# Altium project DBS-Stepper-Module-v1.0.PrjPcb (part 1 of 4)
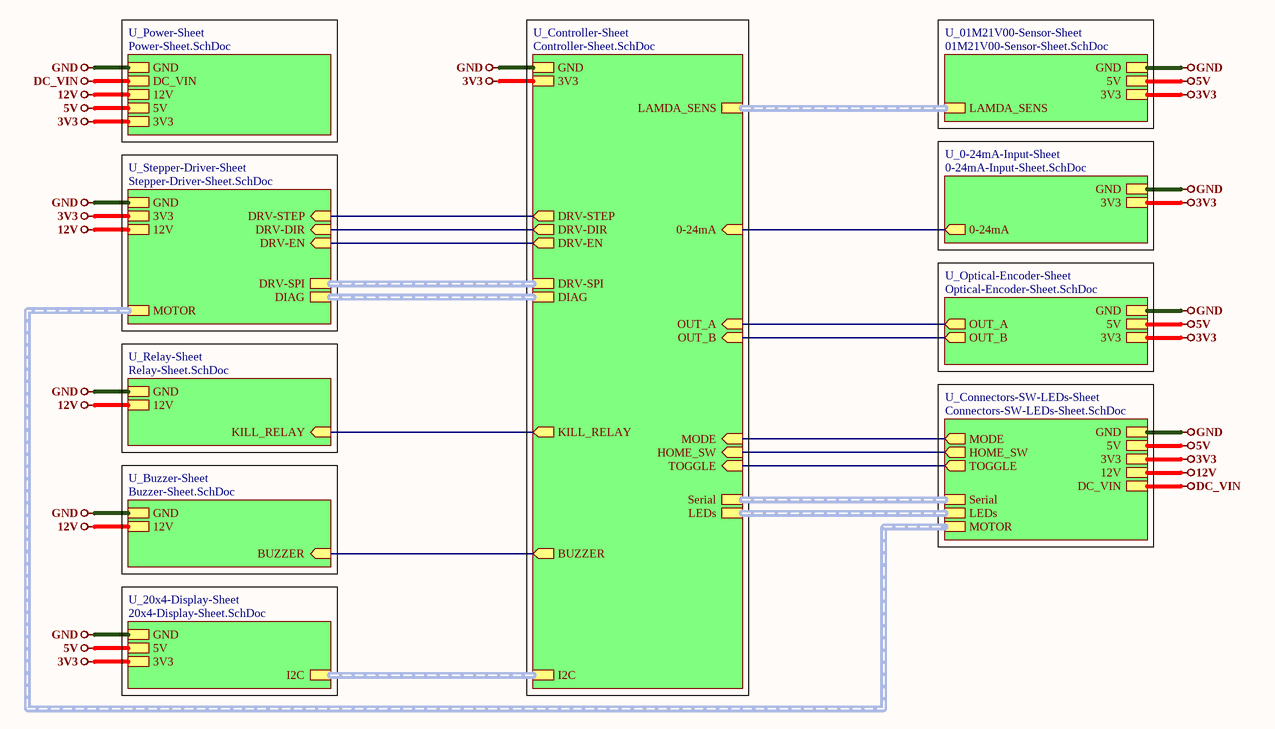
[diagram p0: Top-Sheet.SchDoc]
11 sheets, 149 parts. Net scope: hierarchical (ports join the sheet entries above them; power ports are global).
Board file: PCB_DBS_Module-v1.0.PcbDoc
Sheets:
  Top-Sheet.SchDoc
    U_Power-Sheet = Power-Sheet.SchDoc
    U_Controller-Sheet = Controller-Sheet.SchDoc
    U_Stepper-Driver-Sheet = Stepper-Driver-Sheet.SchDoc
    U_Relay-Sheet = Relay-Sheet.SchDoc
    U_Buzzer-Sheet = Buzzer-Sheet.SchDoc
    U_20x4-Display-Sheet = 20x4-Display-Sheet.SchDoc
    U_01M21V00-Sensor-Sheet = 01M21V00-Sensor-Sheet.SchDoc
    U_0-24mA-Input-Sheet = 0-24mA-Input-Sheet.SchDoc
    U_Optical-Encoder-Sheet = Optical-Encoder-Sheet.SchDoc
    U_Connectors-SW-LEDs-Sheet = Connectors-SW-LEDs-Sheet.SchDoc

## Sheet Top-Sheet.SchDoc
size A4; SheetNumber: 1; SheetTotal: 11

### Sub-sheets
U_0-24mA-Input-Sheet = 0-24mA-Input-Sheet.SchDoc: GND, 3V3, 0-24mA (out)
U_01M21V00-Sensor-Sheet = 01M21V00-Sensor-Sheet.SchDoc: GND, 5V, 3V3, LAMDA_SENS (harness LAMDA_SENS)
U_20x4-Display-Sheet = 20x4-Display-Sheet.SchDoc: GND, 5V, 3V3, I2C (harness I2C)
U_Buzzer-Sheet = Buzzer-Sheet.SchDoc: GND, 12V, BUZZER (in)
U_Connectors-SW-LEDs-Sheet = Connectors-SW-LEDs-Sheet.SchDoc: GND, 5V, 3V3, DC_VIN, Serial (harness Serial), MODE (out), HOME_SW (out), TOGGLE (out), MOTOR (harness MOTOR), 12V, LEDs (harness LEDs)
U_Controller-Sheet = Controller-Sheet.SchDoc: GND, 3V3, DRV-SPI (harness DRV-SPI), DIAG (harness DIAG), DRV-STEP (out), DRV-DIR (out), DRV-EN (out), KILL_RELAY (out), BUZZER (out), I2C (harness I2C), LAMDA_SENS (harness LAMDA_SENS), 0-24mA (in), OUT_A (in), OUT_B (in), Serial (harness Serial), MODE (in), HOME_SW (in), TOGGLE (in), LEDs (harness LEDs)
U_Optical-Encoder-Sheet = Optical-Encoder-Sheet.SchDoc: GND, 5V, 3V3, OUT_A (out), OUT_B (out)
U_Power-Sheet = Power-Sheet.SchDoc: GND, DC_VIN, 12V, 5V, 3V3
U_Relay-Sheet = Relay-Sheet.SchDoc: GND, 12V, KILL_RELAY (in)
U_Stepper-Driver-Sheet = Stepper-Driver-Sheet.SchDoc: GND, 3V3, 12V, MOTOR (harness MOTOR), DRV-SPI (harness DRV-SPI), DIAG (harness DIAG), DRV-STEP (in), DRV-DIR (in), DRV-EN (in)

### Nets
3V3: sheet U_Power-Sheet/3V3, sheet U_Controller-Sheet/3V3, sheet U_Stepper-Driver-Sheet/3V3, sheet U_20x4-Display-Sheet/3V3, sheet U_01M21V00-Sensor-Sheet/3V3, sheet U_0-24mA-Input-Sheet/3V3, sheet U_Optical-Encoder-Sheet/3V3, sheet U_Connectors-SW-LEDs-Sheet/3V3
5V: sheet U_Power-Sheet/5V, sheet U_20x4-Display-Sheet/5V, sheet U_01M21V00-Sensor-Sheet/5V, sheet U_Optical-Encoder-Sheet/5V, sheet U_Connectors-SW-LEDs-Sheet/5V
12V: sheet U_Power-Sheet/12V, sheet U_Stepper-Driver-Sheet/12V, sheet U_Relay-Sheet/12V, sheet U_Buzzer-Sheet/12V, sheet U_Connectors-SW-LEDs-Sheet/12V
DC_VIN: sheet U_Power-Sheet/DC_VIN, sheet U_Connectors-SW-LEDs-Sheet/DC_VIN
GND: sheet U_Power-Sheet/GND, sheet U_Controller-Sheet/GND, sheet U_Stepper-Driver-Sheet/GND, sheet U_Relay-Sheet/GND, sheet U_Buzzer-Sheet/GND, sheet U_20x4-Display-Sheet/GND, sheet U_01M21V00-Sensor-Sheet/GND, sheet U_0-24mA-Input-Sheet/GND, sheet U_Optical-Encoder-Sheet/GND, sheet U_Connectors-SW-LEDs-Sheet/GND
0-24mA: sheet U_Controller-Sheet/0-24mA, sheet U_0-24mA-Input-Sheet/0-24mA
BUZZER: sheet U_Controller-Sheet/BUZZER, sheet U_Buzzer-Sheet/BUZZER
DRV-DIR: sheet U_Controller-Sheet/DRV-DIR, sheet U_Stepper-Driver-Sheet/DRV-DIR
DRV-EN: sheet U_Controller-Sheet/DRV-EN, sheet U_Stepper-Driver-Sheet/DRV-EN
DRV-STEP: sheet U_Controller-Sheet/DRV-STEP, sheet U_Stepper-Driver-Sheet/DRV-STEP
HOME_SW: sheet U_Controller-Sheet/HOME_SW, sheet U_Connectors-SW-LEDs-Sheet/HOME_SW
KILL_RELAY: sheet U_Controller-Sheet/KILL_RELAY, sheet U_Relay-Sheet/KILL_RELAY
MODE: sheet U_Controller-Sheet/MODE, sheet U_Connectors-SW-LEDs-Sheet/MODE
OUT_A: sheet U_Controller-Sheet/OUT_A, sheet U_Optical-Encoder-Sheet/OUT_A
OUT_B: sheet U_Controller-Sheet/OUT_B, sheet U_Optical-Encoder-Sheet/OUT_B
TOGGLE: sheet U_Controller-Sheet/TOGGLE, sheet U_Connectors-SW-LEDs-Sheet/TOGGLE

### Buses and harness runs
harness sheet U_01M21V00-Sensor-Sheet/LAMDA_SENS = sheet U_Controller-Sheet/LAMDA_SENS
harness sheet U_20x4-Display-Sheet/I2C = sheet U_Controller-Sheet/I2C
harness sheet U_Connectors-SW-LEDs-Sheet/LEDs = sheet U_Controller-Sheet/LEDs
harness sheet U_Connectors-SW-LEDs-Sheet/MOTOR = sheet U_Stepper-Driver-Sheet/MOTOR
harness sheet U_Connectors-SW-LEDs-Sheet/Serial = sheet U_Controller-Sheet/Serial
harness sheet U_Controller-Sheet/DIAG = sheet U_Stepper-Driver-Sheet/DIAG
harness sheet U_Controller-Sheet/DRV-SPI = sheet U_Stepper-Driver-Sheet/DRV-SPI

### Notes on the sheet
- File:
- Title:
- Date:
- Page
- Num:
- Total:
- Drawn By: Huzaifa Ali

## Sheet Power-Sheet.SchDoc
size A4; SheetNumber: 2; SheetTotal: 11
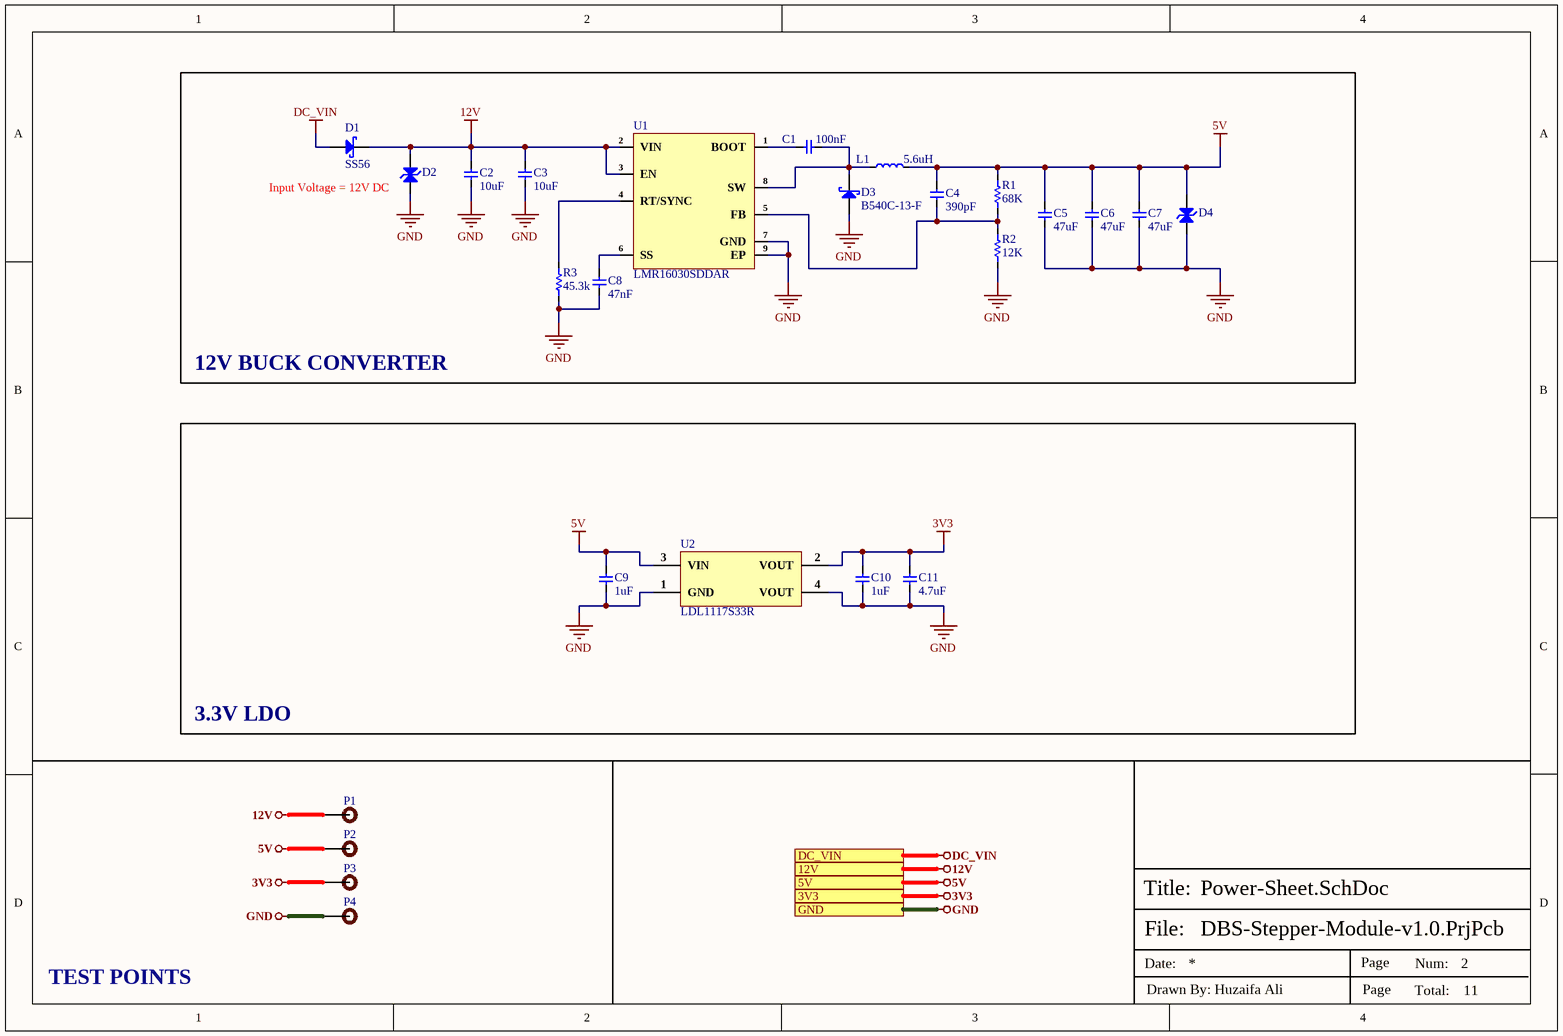
[diagram p1: Power-Sheet.SchDoc]

### Parts
C1  100nF  [Cap-0603]
C2  10uF  [Cap-1206]
C3  10uF  [Cap-1206]
C4  390pF  [Cap-0402]
C5  47uF  [Cap-1206]
C6  47uF  [Cap-1206]
C7  47uF  [Cap-1206]
C8  47nF  [Cap-0402]
C9  1uF  [Cap-0603]
C10  1uF  [Cap-0603]
C11  4.7uF  [Cap-0603]
D1  SS56  [SMA]
D2  SMAJ12CA  [SMA Bi Directional]  (value not drawn)
D3  B540C-13-F  [SMC]
D4  SMAJ5.0CA  [SMA Bi Directional]  (value not drawn)
L1  5.6uH  [FXL0630-5R6-M]
P1  TEST POINT 0.5mm Dia  [Test-point - 0.5mm]  (value not drawn)
P2  TEST POINT 0.5mm Dia  [Test-point - 0.5mm]  (value not drawn)
P3  TEST POINT 0.5mm Dia  [Test-point - 0.5mm]  (value not drawn)
P4  TEST POINT 0.5mm Dia  [Test-point - 0.5mm]  (value not drawn)
R1  68K  [Res-0603]
R2  12K  [Res-0603]
R3  45.3k  [Res-0402]
U1  LMR16030SDDAR  [8-SO-EP_]
U2  LDL1117S33R  [SOT- 223]

### Blocks framed on the sheet
12V BUCK CONVERTER: C1-C8 D1-D4 L1 R1-R3 U1
3.3V LDO: C9-C11 U2

### Ports
3V3 (see Top-Sheet[1A], 0-24mA-Input-Sheet[3D], 01M21V00-Sensor-Sheet[3D], 20x4-Display-Sheet[3D], Connectors-SW-LEDs-Sheet[3D], Controller-Sheet[3D], Optical-Encoder-Sheet[3D], Stepper-Driver-Sheet[3D]), 5V (see Top-Sheet[1A], 01M21V00-Sensor-Sheet[3D], 20x4-Display-Sheet[3D], Connectors-SW-LEDs-Sheet[3D], Optical-Encoder-Sheet[3D]), 12V (see Top-Sheet[1A], Buzzer-Sheet[3D], Connectors-SW-LEDs-Sheet[3D], Relay-Sheet[3D], Stepper-Driver-Sheet[3D]), DC_VIN (see Top-Sheet[1A], Connectors-SW-LEDs-Sheet[3D]), GND (see Top-Sheet[1A], 0-24mA-Input-Sheet[3D], 01M21V00-Sensor-Sheet[3D], 20x4-Display-Sheet[3D], Buzzer-Sheet[3D], Connectors-SW-LEDs-Sheet[3D], Controller-Sheet[3D], Optical-Encoder-Sheet[3D], Relay-Sheet[3D], Stepper-Driver-Sheet[3D])

### Nets
3V3: C10.2 C11.2 P3.1 U2.2(VOUT) ; port 3V3
5V: C4.2 C5.2 C6.2 C7.2 C9.2 D4.2(K) L1.2 P2.1 R1.2 U2.3(VIN) ; port 5V
12V: C2.2 C3.2 D1.1(K) D2.2(K) P1.1 U1.2(VIN) U1.3(EN) ; port 12V
DC_VIN: D1.2(A) ; port DC_VIN
GND: C2.1 C3.1 C5.1 C6.1 C7.1 C8.1 C9.1 C10.1 C11.1 D2.1(A) D3.2(A) D4.1(A) P4.1 R2.1 R3.1 U1.7(GND) U1.9(EP) U2.1(GND) U2.4(VOUT) ; port GND
NetC1_1: C1.1 D3.1(K) L1.1 U1.8(SW)
NetC1_2: C1.2 U1.1(BOOT)
NetC4_1: C4.1 R1.1 R2.2 U1.5(FB)
NetC8_2: C8.2 U1.6(SS)
NetR3_2: R3.2 U1.4(RT/SYNC)

### Notes on the sheet
- (near D2) Input Voltage = 12V DC
- TEST POINTS
- File:
- Title:
- Date:
- Page
- Num:
- Total:
- Drawn By: Huzaifa Ali

### Library data of the parts
C1 = CC0603KRX5R9BB104: CAP CER 0.1UF 50V X5R 0603; Manufacturer: Yageo; Tolerance: 10%; Item Type: Capacitor; Supplier 1: Digi-Key; Manufacturer Part Number: CC0603KRX5R9BB104; RoHS: Yes; Category: Ceramic Capacitors; Stock 1: 152253; Pricing 1: 1=0.10000, 10=0.05200, 50=0.02820, 100=0.02310, 500=0.01648, 1000=0.01294 (USD); Mount: Surface Mount; Case/Package: 0603; Case Code (Imperial): 0603; Case Code (Metric): 1608; Weight: 7.1E-05oz; Min Operating Temperature: -55°C; Max Operating Temperature: 85°C; Capacitance: 100nF; Packaging: Tape and Reel; Voltage Rating: 50V; Dielectric: X5R; Termination: SMD/SMT; Voltage Rating (DC): 50V; Package Quantity: 4000; Length: 0.063inch; Width: 0.031inch; Thickness: 0.035inch; Lead Free: Lead Free; Halogen Free: Halogen Free; ComponentLink1URL: http://www.mouser.com/ds/2/447/Yageo_UPY-GP_NP0_16V-to-50V_9-358835.pdf?src-supplier=Mouser; ComponentLink1Description: http://www.mouser.com/ds/2/447/Yageo_UPY-GP_NP0_16V-to-50V_9-358835.pdf?src-supplier=Mouser; ComponentLink2URL: https://www.yageo.com/upload/media/product/productsearch/datasheet/mlcc/UPY-GPHC_X5R_4V-to-50V_26.pdf?src-supplier=Digi-Key; ComponentLink2Description: https://www.yageo.com/upload/media/product/productsearch/datasheet/mlcc/UPY-GPHC_X5R_4V-to-50V_26.pdf?src-supplier=Digi-Key; ComponentLink3URL: http://www.yageo.com/exep/pages/download/literatures/ProductSelectionGuide%202014_Final_2.pdf?src-supplier=Digi-Key; ComponentLink3Description: http://www.yageo.com/exep/pages/download/literatures/ProductSelectionGuide%202014_Final_2.pdf?src-supplier=Digi-Key; Supplier Part Number 1: 311-4046-1-ND; LCSC Part Number: C110022
C2 C3 = CC1206KKX5R9BB106: CAP CER 10UF 50V X5R 1206; Manufacturer: Yageo; Item Type: Capacitors; Material: 4241ConductorMaterial; Tolerance: 10%; Supplier: Future Electronics; Supplier Part Number: 2072123; Manufacturer Part Number: CC1206KKX5R9BB106; RoHS: Yes; Stock: 220000; Pricing: 2000=0.0907, 6000=0.0872, 10000=0.0856, 30000=0.0823, 50000=0.0795 (USD); Mounting Technology: Surface Mount; Case/Package: 1206; Case Code (Imperial): 1206; Case Code (Metric): 3216; Min Operating Temperature: -55°C; Max Operating Temperature: 85°C; Packaging: Cut Tape; Value: 10uF; Voltage Rating: 50V; Voltage Rating (DC): 50V; Dielectric: X5R; Series: CC; Length: 0.126inch; Width: 0.063inch; Height: 1.9mm; Thickness: 0.075inch; Lead Free: Lead Free; Halogen Free: Halogen Free; RoHS Compliant: Yes; ComponentLink1URL: https://datasheet.octopart.com/CC1206KKX5R9BB106-Yageo-datasheet-170350636.pdf?src-supplier=Future+Electronics; ComponentLink1Description: https://datasheet.octopart.com/CC1206KKX5R9BB106-Yageo-datasheet-170350636.pdf?src-supplier=Future+Electronics; ComponentLink2URL: https://datasheet.octopart.com/CC1206KKX5R9BB106-Yageo-datasheet-145016144.pdf?src-supplier=Future+Electronics; ComponentLink2Description: https://datasheet.octopart.com/CC1206KKX5R9BB106-Yageo-datasheet-145016144.pdf?src-supplier=Future+Electronics; ComponentLink3URL: http://www.yageo.com/documents/recent/UPY-GPHC_X5R_4V-to-50V_25.pdf?src-supplier=Digikey; ComponentLink3Description: http://www.yageo.com/documents/recent/UPY-GPHC_X5R_4V-to-50V_25.pdf?src-supplier=Digikey; LCSC Part Number: C100122
C4 = CGA2B2C0G1H391J050BA: CAP CER 390PF 50V C0G 0402; Manufacturer: TDK; Item Type: Capacitors; Supplier: Digikey; Supplier Part Number: 445-5603-1-ND; Manufacturer Part Number: CGA2B2C0G1H391J050BA; RoHS: Yes; Stock: 103846; Pricing: 1=0.1, 10=0.048, 50=0.0278, 100=0.0216, 500=0.01622, 1000=0.01275, 2500=0.01159, 5000=0.01066 (USD); ComponentLink1URL: https://datasheet.ciiva.com/24219/cga2b2c0g1h391j050ba-265720-24219960.pdf?src-supplier=Mouser; ComponentLink1Description: https://datasheet.ciiva.com/24219/cga2b2c0g1h391j050ba-265720-24219960.pdf?src-supplier=Mouser; ComponentLink2URL: https://datasheet.ciiva.com/7975/1807242-7975259.pdf?src-supplier=Element14; ComponentLink2Description: https://datasheet.ciiva.com/7975/1807242-7975259.pdf?src-supplier=Element14
C5-C7 = GRM31CR61E476ME44L: CAP CER 47UF 25V X5R 1206; Manufacturer: Murata; Tolerance: 20%; Item Type: Capacitor; Supplier 1: Digi-Key; Manufacturer Part Number: GRM31CR61E476ME44L; RoHS: Yes; Category: Ceramic Capacitors; Capacitance: 47uF; Voltage Rating (DC): 25V; Dielectric: X5R; Length: 3.2mm; Width: 1.6mm; Thickness: 1.6mm; ComponentLink1URL: https://search.murata.co.jp/Ceramy/image/img/A01X/partnumbering_e_01.pdf?src-supplier=Digi-Key; ComponentLink1Description: https://search.murata.co.jp/Ceramy/image/img/A01X/partnumbering_e_01.pdf?src-supplier=Digi-Key; Supplier Part Number 1: 490-16268-2-ND; LCSC Part Number: C403725
C8 = CC0402KRX7R9BB473: CAP CER 0.047UF 50V X7R 0402; Manufacturer: Yageo; Material: 4241ConductorMaterial; Tolerance: 10%; Temperature Coefficient: 30ppm/°C; Dielectric: 1511DielectricType; Item Type: Capacitor; Supplier: Future Electronics; Supplier Part Number: 2095687; Manufacturer Part Number: CC0402KRX7R9BB473; RoHS: Yes; Category: Ceramic Capacitors; Stock: 1130000; Pricing: 10000=0.0044, 40000=0.0042, 100000=0.004, 150000=0.0041, 250000=0.0039, 400000=0.0037, 500000=0.0038 (USD); Mounting Technology: Surface Mount; Case/Package: 0402; Case Code (Imperial): 0402; Case Code (Metric): 1005; Min Operating Temperature: -55°C; Max Operating Temperature: 125°C; Packaging: Tape and Reel; Value: 47nF; Voltage Rating: 50V; Series: CC; Voltage Rating (DC): 50V; Length: 0.039inch; Width: 0.02inch; Height: 550um; Thickness: 0.022inch; RoHS Compliant: Yes; Halogen Free: 5694HalogenFree; Lead Free: 5697LeadFree; ComponentLink1URL: https://datasheet.octopart.com/CC0402KRX7R9BB473-Yageo-datasheet-166511530.pdf?src-supplier=Future+Electronics; ComponentLink1Description: https://datasheet.octopart.com/CC0402KRX7R9BB473-Yageo-datasheet-166511530.pdf?src-supplier=Future+Electronics; ComponentLink2URL: http://www.yageo.com/documents/recent/UPY-GPHC_X7R_6.3V-to-50V_18.pdf?src-supplier=Digikey; ComponentLink2Description: http://www.yageo.com/documents/recent/UPY-GPHC_X7R_6.3V-to-50V_18.pdf?src-supplier=Digikey; ComponentLink3URL: https://datasheet.octopart.com/CC0402KRX7R9BB473-Yageo-datasheet-140260305.pdf?src-supplier=Newark; ComponentLink3Description: https://datasheet.octopart.com/CC0402KRX7R9BB473-Yageo-datasheet-140260305.pdf?src-supplier=Newark; LCSC Part Number: C272875
C9 C10 = CL10A105KB8NNNC: CAP CER 1UF 50V X5R 0603; Manufacturer: Samsung; Material: 4241ConductorMaterial; Tolerance: 10%; Item Type: Capacitor; Supplier: Avnet; Supplier Part Number: CL10A105KB8NNNC; Manufacturer Part Number: CL10A105KB8NNNC; RoHS: Yes; Category: Ceramic Capacitors; Stock: 780446; Pricing: 4000=0.01632, 8000=0.01595, 16000=0.01557, 24000=0.0152, 32000=0.01482 (USD); Mounting Technology: Surface Mount; Case/Package: 0603; Case Code (Metric): 1608; Case Code (Imperial): 0603; Min Operating Temperature: -55°C; Max Operating Temperature: 85°C; Packaging: Tape and Reel; Value: 1uF; Voltage Rating: 50V; Dielectric: X5R; Series: CL; Voltage Rating (DC): 50V; Length: 1.6mm; Depth: 0.8mm; Radiation Hardening: No; RoHS Compliant: Yes; ComponentLink1URL: https://datasheet.ciiva.com/26877/getdatasheetpartid-753736-26877879.pdf?src-supplier=Verical; ComponentLink1Description: https://datasheet.ciiva.com/26877/getdatasheetpartid-753736-26877879.pdf?src-supplier=Verical; LCSC Part Number: C15849
C11 = CC0603KRX5R7BB475: CAP CER 4.7UF 16V X5R 0603; Manufacturer: Yageo; Tolerance: 10%; Item Type: Capacitor; Supplier 1: Digi-Key; Manufacturer Part Number: CC0603KRX5R7BB475; RoHS: Yes; Category: Ceramic Capacitors; Stock 1: 547703; Pricing 1: 1=0.20000, 10=0.13800, 50=0.08280, 100=0.06990, 500=0.04784, 1000=0.04233 (USD); Mount: Surface Mount; Case/Package: 0603; Case Code (Imperial): 0603; Case Code (Metric): 1608; Weight: 7.1E-05oz; Min Operating Temperature: -55°C; Max Operating Temperature: 85°C; Capacitance: 4.7uF; Voltage Rating: 16V; Voltage Rating (DC): 16V; Packaging: Tape and Reel; Dielectric: X5R; Termination: SMD/SMT; Resistor Type: Ceramic; Series: CC; Length: 1.6mm; Width: 0.8mm; Height: 0.8mm; Thickness: 0.037inch; Depth: 0.8mm; Lead Free: Lead Free; Halogen Free: Halogen Free; RoHS Compliant: Yes; ComponentLink1URL: http://www.mouser.com/ds/2/447/UPY-GPHC_X5R_4V-to-50V_25-1131599.pdf?src-supplier=Mouser; ComponentLink1Description: http://www.mouser.com/ds/2/447/UPY-GPHC_X5R_4V-to-50V_25-1131599.pdf?src-supplier=Mouser; ComponentLink2URL: http://www.yageo.com/documents/recent/UPY-GPHC_X5R_4V-to-50V_25.pdf?src-supplier=Digi-Key; ComponentLink2Description: http://www.yageo.com/documents/recent/UPY-GPHC_X5R_4V-to-50V_25.pdf?src-supplier=Digi-Key; Supplier Part Number 1: 311-1785-1-ND; LCSC Part Number: C277476
D1 = SS56: DIODE SCHOTTKY 60V 5A SMA; Manufacturer: MDD; LCSC Par Number: C65009; Manufacturer Part Number: SS56; Iterm Type: Diode; ComponentLink1Description: LCSC; ComponentLink1URL: https://www.lcsc.com/product-detail/Schottky-Barrier-Diodes-SBD_MDD-Microdiode-Electronics-SS56_C65009.html
D2 = SMAJ12CA: 20.1A 19.9V 13.3V 12V SMA(DO-214AC) Electrostatic and Surge Protection (TVS/ESD) ROHS; Manufacturer: MDD; Manufacturer Part Number: SMAJ12CA; Package: SMA(DO-214AC); LCSC Part Number: C110042; Item Type: (TVS/ESD); ComponentLink1Description: LCSC; ComponentLink1URL: https://www.lcsc.com/product-detail/Electrostatic-and-Surge-Protection-TVS-ESD_MDD-Microdiode-Semiconductor-SMAJ12CA_C110042.html
D3 = B540C-13-F: DIODE SCHOTTKY 40V 5A SMC; Manufacturer: Diodes; Max Reverse Current: 500uA; Polarity: Standard; Forward Voltage: 550mV; Max Forward Surge Current (Ifsm): 100A; Value: 300pF; Supplier: Future Electronics; Supplier Part Number: 8485369; Manufacturer Part Number: B540C-13-F; RoHS: Yes; Category: Rectifier Diodes; Stock: 381000; Pricing: 3000=0.148, 6000=0.145, 9000=0.143, 12000=0.142, 15000=0.138 (USD); Mounting Technology: Surface Mount; Case/Package: SMC; Weight: 0.007408oz; Min Operating Temperature: -55°C; Max Operating Temperature: 125°C; Packaging: Tape and Reel; Forward Current: 5A; Max Repetitive Reverse Voltage (Vrrm): 40V; Package Quantity: 3000; Output Current: 5A; Series: -; Average Rectified Current: 5A; Termination: SMD/SMT; Voltage Rating (DC): 40V; Current Rating: 5A; Max Reverse Voltage (DC): 40V; Current: 5A; Voltage: 40V; Length: 7.11mm; Width: 6.22mm; Height: 2.5mm; Lead Free: Lead Free; RoHS Compliant: Yes; LCSC Part Number: C72264; Item Type: Diode
D4 = SMAJ5.0CA: TVS DIODE 5VWM 9.2VC SMA; Manufacturer: FTR; Item Type: C693487; Manufacturer Part Number: SMAJ5.0CA; Package: SMA(DO-214AC); LCSC Part Number: Diode; ComponentLink1Description: LCSC; ComponentLink1URL: https://www.lcsc.com/product-detail/TVS_GOODWORK-SMAJ5-0CA_C908809.html
L1 = FXL0630-5R6-M: 5.5A 5.6uH Molding Choke ±20% 6.5A SMD,6.6x7mm Power Inductors ROHS; Manufacturer: cjiang; Manufacturer Part Number: FXL0630-5R6-M; Package: SMD,6.6x7mm; LCSC Part Number: C475914; Item Type: Inductor; ComponentLink1Description: LCSC; ComponentLink1URL: https://www.lcsc.com/product-detail/Power-Inductors_cjiang-Changjiang-Microelectronics-Tech-FXL0630-5R6-M_C475914.html
P1-P4 = TEST POINT 0.5mm Dia: Test Point ON; Item Type: Test Point
R1 = RT0603BRD0768KL: RES SMD 68K OHM 0.1% 1/10W 0603; Manufacturer: Yageo; Resistance: 68kR; Power Rating: 100mW; Voltage Rating: 75V; Temperature Coefficient: 25ppm/°C; Voltage Rating (DC): 50V; Supplier 1: Digi-Key; Manufacturer Part Number: RT0603BRD0768KL; RoHS: Yes; Category: Chip SMD Resistors; Stock 1: 45000; Pricing 1: 1=0.34000, 10=0.28800, 100=0.11260, 1000=0.04716, 2500=0.04322 (USD); Case/Package: 0603; Case Code (Metric): 1608; Case Code (Imperial): 0603; Contact Plating: Tin,Matte; Min Operating Temperature: -55°C; Max Operating Temperature: 125°C; Tolerance: 0.1%; Packaging: Tape and Reel; Resistor Type: Thin Film; Termination: SMD/SMT; Series: RT; Construction: Rectangular; Length: 1.6mm; Width: 800um; Depth: 0.8mm; Radiation Hardening: No; Military Standard: Not; Lead Free: Lead Free; RoHS Compliant: Yes; ComponentLink1URL: https://datasheet.ciiva.com/12694/pyu-rt-1-to-0-05-rohs-l-4-12694907.pdf?src-supplier=Mouser; ComponentLink1Description: https://datasheet.ciiva.com/12694/pyu-rt-1-to-0-05-rohs-l-4-12694907.pdf?src-supplier=Mouser; Supplier Part Number 1: YAG4586CT-ND
R2 = RC0603FR-0712KL: RES 12K OHM 1% 1/10W 0603; Manufacturer: Yageo; Value: 12kR; Power Rating: 100mW; Voltage Rating (DC): 50V; Temperature Coefficient: 100ppm/°C; Item Type: Resistor; Supplier: Future Electronics; Supplier Part Number: 6276984; Manufacturer Part Number: RC0603FR-0712KL; RoHS: Yes; Category: Chip SMD Resistors; Stock: 15340000; Pricing: 5000=0.0028, 75000=0.0015, 100000=0.0026, 250000=0.0014, 375000=0.0025, 750000=0.0013, 1250000=0.0024, 2500000=0.0012, 5000000=0.0022 (USD); Case/Package: 0603; Pins: 2; Case Code (Imperial): 0603; Case Code (Metric): 1608; Min Operating Temperature: -55°C; Max Operating Temperature: 155°C; Tolerance: 1%; Packaging: Tape and Reel; Resistor Type: Thick Film; Voltage Rating: 50V; Termination: SMD/SMT; Number of Terminations: 2; Max Power Dissipation: 100mW; Features: Moisture Resistant; Series: RC; Construction: Rectangular; Resistance Tolerance: 1%; Length: 1.6mm; Width: 0.8mm; Depth: 0.8mm; Reach SVHC Compliant: No; RoHS Compliant: Yes; Lead Free: 5697LeadFree; Military Standard: Not; ComponentLink1URL: https://datasheet.ciiva.com/46412/443971-46412842.pdf?src-supplier=Element14; ComponentLink1Description: https://datasheet.ciiva.com/46412/443971-46412842.pdf?src-supplier=Element14; ComponentLink2URL: https://datasheet.ciiva.com/2454/pyu-r-int-thick-7-2454283.pdf?src-supplier=Digikey; ComponentLink2Description: https://datasheet.ciiva.com/2454/pyu-r-int-thick-7-2454283.pdf?src-supplier=Digikey; ComponentLink3URL: https://datasheet.ciiva.com/2454/pyu-r-int-thick-7-2454284.pdf?src-supplier=Digikey; ComponentLink3Description: https://datasheet.ciiva.com/2454/pyu-r-int-thick-7-2454284.pdf?src-supplier=Digikey; ComponentLink4URL: https://datasheet.ciiva.com/2454/pyu-r-int-thick-7-2454282.pdf?src-supplier=Digikey; ComponentLink4Description: https://datasheet.ciiva.com/2454/pyu-r-int-thick-7-2454282.pdf?src-supplier=Digikey; ComponentLink5URL: https://datasheet.ciiva.com/7746/1784430-7746250.pdf?src-supplier=Element14; ComponentLink5Description: https://datasheet.ciiva.com/7746/1784430-7746250.pdf?src-supplier=Element14; ComponentLink6URL: https://datasheet.ciiva.com/7746/1784430-7746251.pdf?src-supplier=Element14; ComponentLink6Description: https://datasheet.ciiva.com/7746/1784430-7746251.pdf?src-supplier=Element14; LCSC Part Number: C114659
R3 = RT0402BRD0745K3L: RES SMD 45.3KOHM 0.1% 1/16W 0402; Manufacturer: Yageo; Value: 45.3kR; Power Rating: 62.5mW; Voltage Rating: 50V; Max Power Dissipation: 63mW; Temperature Coefficient: 25ppm/°C; Item Type: Resistor; Supplier: Future Electronics; Supplier Part Number: 4103245; Manufacturer Part Number: RT0402BRD0745K3L; RoHS: Yes; Category: Chip SMD Resistors; Stock: 10000; Pricing: 10000=0.0205, 20000=0.02, 30000=0.0197, 50000=0.0194, 100000=0.0187 (USD); Case/Package: 0402; Case Code (Imperial): 0402; Case Code (Metric): 1005; Weight: 2.3E-05oz; Min Operating Temperature: -55°C; Max Operating Temperature: 155°C; Packaging: Tape and Reel; Tolerance: 0.1%; Number of Terminations: 2; Termination: SMD/SMT; Voltage Rating (DC): 50V; Series: RT; Length: 1mm; Width: 0.5mm; Height: 0.3mm; Lead Free: Lead Free; RoHS Compliant: Yes; ComponentLink1URL: https://datasheet.ciiva.com/12796/pyu-rt-1-to-0-05-rohs-l-4-12796102.pdf?src-supplier=Mouser; ComponentLink1Description: https://datasheet.ciiva.com/12796/pyu-rt-1-to-0-05-rohs-l-4-12796102.pdf?src-supplier=Mouser; LCSC Part Number: C852795
U1 = LMR16030SDDAR: IC REG BUCK ADJUSTABLE 3A 8SOPWR; Manufacturer: Texas Instruments; Quiescent Current: 40uA; Supplier 1: Digi-Key; Manufacturer Part Number: LMR16030SDDAR; RoHS: Yes; Category: Voltage Regulators - Switching; Stock 1: 10434; Pricing 1: 1=4.08000, 10=3.66300, 25=3.46320, 100=3.00130, 250=2.84736, 500=2.55494, 1000=2.17800 (USD); Number of Pins: 8; Min Operating Temperature: -40°C; Max Operating Temperature: 125°C; Lead Free: Lead Free; RoHS Compliant: Yes; ComponentLink1URL: http://www.ti.com/lit/ds/symlink/lmr16030.pdf?src-supplier=Digi-Key; ComponentLink1Description: http://www.ti.com/lit/ds/symlink/lmr16030.pdf?src-supplier=Digi-Key; ComponentLink2URL: http://www.ti.com/general/docs/suppproductinfo.tsp?distId=10&amp;gotoUrl=http%3A%2F%2Fwww.ti.com%2Flit%2Fgpn%2Flmr16030&src-supplier=Digi-Key; ComponentLink2Description: http://www.ti.com/general/docs/suppproductinfo.tsp?distId=10&amp;gotoUrl=http%3A%2F%2Fwww.ti.com%2Flit%2Fgpn%2Flmr16030&src-supplier=Digi-Key; Supplier Part Number 1: 296-47797-1-ND; LCSC Part Number: C136648; Item Type: IC
U2 = LDL1117S33R: IC REG LINEAR 3.3V 1.2A SOT223; Manufacturer: STMicroelectronics; Output Type: Fixed; Output Configuration: Positive; Number of Regulators: 1; Max Input Voltage: 18V; Dropout Voltage: 600mV; Quiescent Current: 500uA; Power Supply Rejection Ratio (PSRR): 65dB; Supplier 1: Digi-Key; Manufacturer Part Number: LDL1117S33R; Stock 1: 13064; Pricing 1: 1=0.45, 10=0.362, 100=0.2465, 500=0.1849, 1000=0.13867 (USD); Mount: Surface Mount; Case/Package: TO-261-4; Min Operating Temperature: -40°C; Max Operating Temperature: 125°C; Packaging: Tape and Reel; Min Output Voltage: 3.3V; Output Current: 1.2A; Supplier Part Number 1: 497-17239-6-ND; ComponentLink1Description: LCSC; ComponentLink1URL: https://www.lcsc.com/product-detail/Linear-Voltage-Regulators-LDO_STMicroelectronics-LDL1117S33R_C435835.html; LCSC Part Number: C435835; Item Type: IC

## Sheet Controller-Sheet.SchDoc
size A4; SheetNumber: 3; SheetTotal: 11
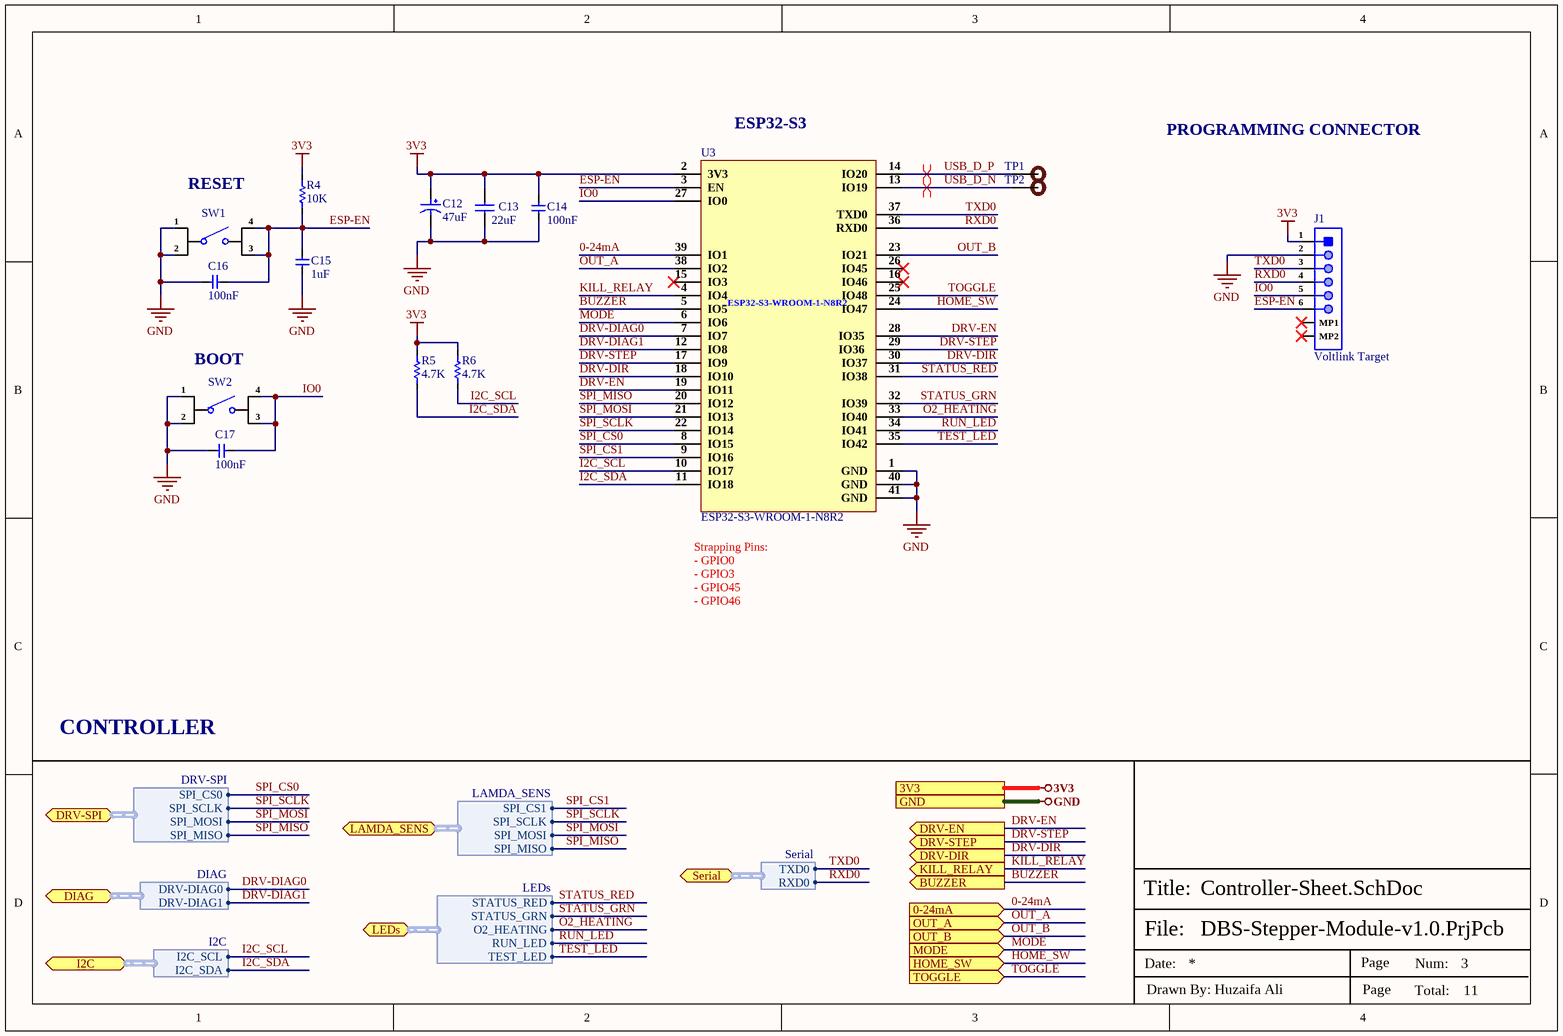
[diagram p2: Controller-Sheet.SchDoc]

### Parts
C12  47uF  [RVT1H470M0607]
C13  22uF  [Cap-0603]
C14  100nF  [Cap-0603]
C15  1uF  [Cap-0603]
C16  100nF  [Cap-0603]
C17  100nF  [Cap-0603]
J1  Voltlink Target  [Voltlink Target]
R4  10K  [Res-0603]
R5  4.7K  [Res-0402]
R6  4.7K  [Res-0402]
SW1  TS-1109S-C-B  [TS-1109S-C-B]  (value not drawn)
SW2  TS-1109S-C-B  [TS-1109S-C-B]  (value not drawn)
TP1  TEST POINT 0.5mm Dia  [Test-point - 0.5mm]  (value not drawn)  (no BOM)
TP2  TEST POINT 0.5mm Dia  [Test-point - 0.5mm]  (value not drawn)  (no BOM)
U3  ESP32-S3-WROOM-1-N8R2  [41-SMD Module]

### Ports
0-24mA (in, see Top-Sheet[3B], 0-24mA-Input-Sheet[1D]), 3V3 (see Top-Sheet[2A], 0-24mA-Input-Sheet[3D], 01M21V00-Sensor-Sheet[3D], 20x4-Display-Sheet[3D], Connectors-SW-LEDs-Sheet[3D], Optical-Encoder-Sheet[3D], Power-Sheet[3D], Stepper-Driver-Sheet[3D]), BUZZER (out, see Top-Sheet[2C], Buzzer-Sheet[1D]), DIAG (bidir, harness DIAG, see Top-Sheet[2B], Stepper-Driver-Sheet[1D]), DRV-DIR (out, see Top-Sheet[2B], Stepper-Driver-Sheet[2D]), DRV-EN (out, see Top-Sheet[2B], Stepper-Driver-Sheet[2D]), DRV-SPI (bidir, harness DRV-SPI, see Top-Sheet[2B], Stepper-Driver-Sheet[1D]), DRV-STEP (out, see Top-Sheet[2A], Stepper-Driver-Sheet[2D]), GND (see Top-Sheet[2A], 0-24mA-Input-Sheet[3D], 01M21V00-Sensor-Sheet[3D], 20x4-Display-Sheet[3D], Buzzer-Sheet[3D], Connectors-SW-LEDs-Sheet[3D], Optical-Encoder-Sheet[3D], Power-Sheet[3D], Relay-Sheet[3D], Stepper-Driver-Sheet[3D]), HOME_SW (in, see Top-Sheet[3B], Connectors-SW-LEDs-Sheet[2D]), I2C (bidir, harness I2C, see Top-Sheet[2C], 20x4-Display-Sheet[1D]), KILL_RELAY (out, see Top-Sheet[2B], Relay-Sheet[1D]), LAMDA_SENS (bidir, harness LAMDA_SENS, see Top-Sheet[3A], 01M21V00-Sensor-Sheet[1D]), LEDs (bidir, harness LEDs, see Top-Sheet[3C], Connectors-SW-LEDs-Sheet[2D]), MODE (in, see Top-Sheet[3B], Connectors-SW-LEDs-Sheet[2D]), OUT_A (in, see Top-Sheet[3B], Optical-Encoder-Sheet[1D]), OUT_B (in, see Top-Sheet[3B], Optical-Encoder-Sheet[1D]), Serial (bidir, harness Serial, see Top-Sheet[3C], Connectors-SW-LEDs-Sheet[1D]), TOGGLE (in, see Top-Sheet[3B], Connectors-SW-LEDs-Sheet[2D])

### Harnesses
DRV-SPI: SPI_CS0, SPI_SCLK, SPI_MOSI, SPI_MISO
DIAG: DRV-DIAG0, DRV-DIAG1
I2C: I2C_SCL, I2C_SDA
LAMDA_SENS: SPI_CS1, SPI_SCLK, SPI_MOSI, SPI_MISO
Serial: TXD0, RXD0
LEDs: STATUS_RED, STATUS_GRN, O2_HEATING, RUN_LED, TEST_LED

### Nets
3V3: C12.1 C13.2 C14.2 J1.1 R4.2 R5.2 R6.2 U3.2(3V3) ; port 3V3
GND: C12.2 C13.1 C14.1 C15.1 C16.2 C17.2 J1.2 SW1.1 SW1.2 SW2.1 SW2.2 U3.1(GND) U3.40(GND) U3.41(GND) ; port GND
0-24mA: U3.39(IO1) ; port 0-24mA
BUZZER: U3.5(IO5) ; port BUZZER
DRV-DIAG0: U3.7(IO7) ; port DIAG.DRV-DIAG0
DRV-DIAG1: U3.12(IO8) ; port DIAG.DRV-DIAG1
DRV-DIR: U3.18(IO10) U3.30(IO37) ; port DRV-DIR
DRV-EN: U3.19(IO11) U3.28(IO35) ; port DRV-EN
DRV-STEP: U3.17(IO9) U3.29(IO36) ; port DRV-STEP
ESP-EN: C15.2 C16.1 J1.6 R4.1 SW1.3 SW1.4 U3.3(EN)
HOME_SW: U3.24(IO47) ; port HOME_SW
I2C_SCL: R6.1 U3.10(IO17) ; port I2C.I2C_SCL
I2C_SDA: R5.1 U3.11(IO18) ; port I2C.I2C_SDA
IO0: C17.1 J1.5 SW2.3 SW2.4 U3.27(IO0)
KILL_RELAY: U3.4(IO4) ; port KILL_RELAY
MODE: U3.6(IO6) ; port MODE
O2_HEATING: U3.33(IO40) ; port LEDs.O2_HEATING
OUT_A: U3.38(IO2) ; port OUT_A
OUT_B: U3.23(IO21) ; port OUT_B
RUN_LED: U3.34(IO41) ; port LEDs.RUN_LED
RXD0: J1.4 U3.36(RXD0) ; port Serial.RXD0
SPI_CS0: U3.8(IO15) ; port DRV-SPI.SPI_CS0
SPI_CS1: U3.9(IO16) ; port LAMDA_SENS.SPI_CS1
SPI_MISO: U3.20(IO12) ; port DRV-SPI.SPI_MISO, port LAMDA_SENS.SPI_MISO
SPI_MOSI: U3.21(IO13) ; port DRV-SPI.SPI_MOSI, port LAMDA_SENS.SPI_MOSI
SPI_SCLK: U3.22(IO14) ; port DRV-SPI.SPI_SCLK, port LAMDA_SENS.SPI_SCLK
STATUS_GRN: U3.32(IO39) ; port LEDs.STATUS_GRN
STATUS_RED: U3.31(IO38) ; port LEDs.STATUS_RED
TEST_LED: U3.35(IO42) ; port LEDs.TEST_LED
TOGGLE: U3.25(IO48) ; port TOGGLE
TXD0: J1.3 U3.37(TXD0) ; port Serial.TXD0
USB_D_N: TP2.1 U3.13(IO19)
USB_D_P: TP1.1 U3.14(IO20)

Not connected (* = marked no-connect by the designer): J1 MP1* MP2*; U3 15(IO3)* 16(IO46)* 26(IO45)*

### Layout directives
differential pair; net class USB_PROGRAM; differential pair class USB_PROGRAM_LINES; rule Impedance Constraint [Min = 85.00    Max = 90.00    ]; rule Matched Net Lengths [Tolerance = 50mil]: USB_D_N, USB_D_P

### Notes on the sheet
- (near U3) ESP32-S3
- PROGRAMMING CONNECTOR
- (near SW1) RESET
- (near SW2) BOOT
- (near U3) Strapping Pins:
  - GPIO0
  - GPIO3
  - GPIO45
  - GPIO46
- CONTROLLER
- File:
- Title:
- Date:
- Page
- Num:
- Total:
- Drawn By: Huzaifa Ali

### Library data of the parts
C12 = RVT1H470M0607: 47uF 50V 66mA@120Hz ±20% SMD,D6.3xL7.7mm Aluminum Electrolytic Capacitors - SMD ROHS; Manufacturer: ROQANG; Manufacturer Part Number: RVT1H470M0607; Package: SMD,D6.3xL7.7mm; LCSC Part Number: C72523; Item Type: Capacitor; ComponentLink1Description: LCSC; ComponentLink1URL: https://www.lcsc.com/product-detail/Aluminum-Electrolytic-Capacitors-SMD_ROQANG-RVT1H470M0607_C72523.html
C13 = CC0603MRX5R6BB226: CAP CER 22UF 10V X5R 0603; Manufacturer: Yageo; Tolerance: 20%; Supplier 1: Digi-Key; Manufacturer Part Number: CC0603MRX5R6BB226; RoHS: Yes; Category: Ceramic Capacitors; Stock 1: 19628; Pricing 1: 1=0.68000, 10=0.48000, 50=0.36300, 100=0.31610, 500=0.23416, 1000=0.19903 (USD); Mount: Surface Mount; Case/Package: 0603; Case Code (Metric): 1608; Case Code (Imperial): 0603; Weight: 7.1E-05oz; Min Operating Temperature: -55°C; Max Operating Temperature: 85°C; Packaging: Tape and Reel; Capacitance: 22uF; Voltage Rating: 10V; Dielectric: X5R; Termination: SMD/SMT; Voltage Rating (DC): 10V; Package Quantity: 4000; Length: 0.063inch; Width: 0.8mm; Height: 0.8mm; Thickness: 0.035inch; Lead Free: Lead Free; Halogen Free: Halogen Free; RoHS Compliant: Yes; ComponentLink1URL: http://www.mouser.com/ds/2/447/Yageo_UPY-GP_NP0_16V-to-50V_9-358835.pdf?src-supplier=Mouser; ComponentLink1Description: http://www.mouser.com/ds/2/447/Yageo_UPY-GP_NP0_16V-to-50V_9-358835.pdf?src-supplier=Mouser; ComponentLink2URL: http://www.yageo.com/documents/recent/UPY-GPHC_X5R_4V-to-50V_25.pdf?src-supplier=Digi-Key; ComponentLink2Description: http://www.yageo.com/documents/recent/UPY-GPHC_X5R_4V-to-50V_25.pdf?src-supplier=Digi-Key; Supplier Part Number 1: 311-1819-1-ND; LCSC Part Number: C109447
C14 C16 C17 = CC0603KRX5R9BB104: as C1 on sheet Power-Sheet; Supplier 1: Digi-Key; Manufacturer Part Number: CC0603KRX5R9BB104; RoHS: Yes; Category: Ceramic Capacitors; Stock 1: 152253; Pricing 1: 1=0.10000, 10=0.05200, 50=0.02820, 100=0.02310, 500=0.01648, 1000=0.01294 (USD); Mount: Surface Mount; Case/Package: 0603; Case Code (Imperial): 0603; Case Code (Metric): 1608; Weight: 7.1E-05oz; Min Operating Temperature: -55°C; Max Operating Temperature: 85°C; Capacitance: 100nF; Packaging: Tape and Reel; Voltage Rating: 50V; Dielectric: X5R; Termination: SMD/SMT; Voltage Rating (DC): 50V; Package Quantity: 4000; Length: 0.063inch; Width: 0.031inch; Thickness: 0.035inch; Lead Free: Lead Free; Halogen Free: Halogen Free; ComponentLink1URL: http://www.mouser.com/ds/2/447/Yageo_UPY-GP_NP0_16V-to-50V_9-358835.pdf?src-supplier=Mouser; ComponentLink1Description: http://www.mouser.com/ds/2/447/Yageo_UPY-GP_NP0_16V-to-50V_9-358835.pdf?src-supplier=Mouser; ComponentLink2URL: https://www.yageo.com/upload/media/product/productsearch/datasheet/mlcc/UPY-GPHC_X5R_4V-to-50V_26.pdf?src-supplier=Digi-Key; ComponentLink2Description: https://www.yageo.com/upload/media/product/productsearch/datasheet/mlcc/UPY-GPHC_X5R_4V-to-50V_26.pdf?src-supplier=Digi-Key; ComponentLink3URL: http://www.yageo.com/exep/pages/download/literatures/ProductSelectionGuide%202014_Final_2.pdf?src-supplier=Digi-Key; ComponentLink3Description: http://www.yageo.com/exep/pages/download/literatures/ProductSelectionGuide%202014_Final_2.pdf?src-supplier=Digi-Key; Supplier Part Number 1: 311-4046-1-ND; LCSC Part Number: C110022
C15 = CL10A105KB8NNNC: as C9 on sheet Power-Sheet; Supplier: Avnet; Supplier Part Number: CL10A105KB8NNNC; Manufacturer Part Number: CL10A105KB8NNNC; RoHS: Yes; Category: Ceramic Capacitors; Stock: 780446; Pricing: 4000=0.01632, 8000=0.01595, 16000=0.01557, 24000=0.0152, 32000=0.01482 (USD); Mounting Technology: Surface Mount; Case/Package: 0603; Case Code (Metric): 1608; Case Code (Imperial): 0603; Min Operating Temperature: -55°C; Max Operating Temperature: 85°C; Packaging: Tape and Reel; Value: 1uF; Voltage Rating: 50V; Dielectric: X5R; Series: CL; Voltage Rating (DC): 50V; Length: 1.6mm; Depth: 0.8mm; Radiation Hardening: No; RoHS Compliant: Yes; ComponentLink1URL: https://datasheet.ciiva.com/26877/getdatasheetpartid-753736-26877879.pdf?src-supplier=Verical; ComponentLink1Description: https://datasheet.ciiva.com/26877/getdatasheetpartid-753736-26877879.pdf?src-supplier=Verical; LCSC Part Number: C15849
J1 = C145963: 1x6P SH 1 1mm 6 SMD,P=1mm Wire To Board / Wire To Wire Connector ROHS; Manufacturer: BOOMELE; Manufacturer Part Number: C145963; Package: SMD,P=1mm; LCSC Part Number: C145963; Item Type: Connector; ComponentLink1Description: LCSC; ComponentLink1URL: https://www.lcsc.com/product-detail/Wire-To-Board-Wire-To-Wire-Connector_BOOMELE-Boom-Precision-Elec-C145963_C145963.html
R4 = RC0603FR-0710KL: RES SMD 10K Ohm 1% 1/10W 0603; Manufacturer: Yageo; Resistance: 10kR; Temperature Coefficient: 100ppm/°C; Voltage Rating (DC): 50V; Power Rating: 100mW; Voltage Rating: 75V; Item Type: Resistor; Supplier 1: Digi-Key; Manufacturer Part Number: RC0603FR-0710KL; RoHS: Yes; Category: Chip SMD Resistors; Stock 1: 25249139; Pricing 1: 1=0.10000, 10=0.02400, 100=0.00970, 1000=0.00436, 2500=0.00378 (USD); Case/Package: 0603; Number of Pins: 2; Case Code (Imperial): 0603; Case Code (Metric): 1608; Weight: 7.1E-05oz; Size Code: 0603; Min Operating Temperature: -55°C; Max Operating Temperature: 155°C; Tolerance: 1%; Resistor Type: Thick Film; Packaging: Tape and Reel; Termination: SMD/SMT; Features: Moisture Resistant; Series: RC; Max Power Dissipation: 100mW; Number of Terminations: 2; Resistance Tolerance: 1%; Construction: Rectangular; Length: 1.6mm; Width: 0.8mm; Height: 0.45mm; Depth: 0.8mm; Lead Pitch: 0.3mm; REACH SVHC: Unknown; Lead Free: Lead Free; Military Standard: Not; RoHS Compliant: Yes; ComponentLink1URL: https://datasheet.ciiva.com/7660/38590-7660789.pdf?src-supplier=Element14; ComponentLink1Description: https://datasheet.ciiva.com/7660/38590-7660789.pdf?src-supplier=Element14; ComponentLink2URL: https://datasheet.ciiva.com/7983/443971-7983596.pdf?src-supplier=Element14; ComponentLink2Description: https://datasheet.ciiva.com/7983/443971-7983596.pdf?src-supplier=Element14; ComponentLink3URL: https://datasheet.ciiva.com/22747/443971-22747519.pdf?src-supplier=Element14; ComponentLink3Description: https://datasheet.ciiva.com/22747/443971-22747519.pdf?src-supplier=Element14; ComponentLink4URL: https://datasheet.ciiva.com/46440/1868787-46440891.pdf?src-supplier=Element14; ComponentLink4Description: https://datasheet.ciiva.com/46440/1868787-46440891.pdf?src-supplier=Element14; ComponentLink5URL: https://datasheet.ciiva.com/7746/1738695-7746239.pdf?src-supplier=Element14; ComponentLink5Description: https://datasheet.ciiva.com/7746/1738695-7746239.pdf?src-supplier=Element14; ComponentLink6URL: https://datasheet.ciiva.com/15189/getdatasheetpartid-409289-15189591.pdf?src-supplier=Verical; ComponentLink6Description: https://datasheet.ciiva.com/15189/getdatasheetpartid-409289-15189591.pdf?src-supplier=Verical; Supplier Part Number 1: 311-10.0KHRCT-ND; LCSC Part Number: C98220
R5 R6 = RC0402FR-074K7L: RES 4.7K OHM 1% 1/16W 0402; Manufacturer: Yageo; Voltage Rating (DC): 50V; Power Rating: 62.5mW; Resistance: 4.7kR; Temperature Coefficient: 100ppm/°C; Max Power Dissipation: 63mW; Item Type: Resistor; Supplier 1: Avnet; Manufacturer Part Number: RC0402FR-074K7L; RoHS: Yes; Category: Chip SMD Resistors; Stock 1: 2420000; Pricing 1: 10000=0.00085 (USD); Case/Package: 0402; Number of Pins: 2; Case Code (Imperial): 0402; Case Code (Metric): 1005; Size Code: 0402; Min Operating Temperature: -55°C; Max Operating Temperature: 155°C; Tolerance: 1%; Voltage Rating: 50V; Packaging: Tape and Reel; Resistor Type: Thick Film; Termination: SMD/SMT; Features: Moisture Resistant; Series: RC; Number of Terminations: 2; Resistance Tolerance: 1%; Construction: Rectangular; Length: 1mm; Width: 0.5mm; Height: 0.32mm; Depth: 0.5mm; Height - Seated (Max): 0.016inch; RoHS Compliant: Yes; Reach SVHC Compliant: Yes; Military Standard: Not; Lead Free: Lead Free; ComponentLink1URL: https://datasheet.ciiva.com/22661/1686128-22661342.pdf?src-supplier=Element14; ComponentLink1Description: https://datasheet.ciiva.com/22661/1686128-22661342.pdf?src-supplier=Element14; ComponentLink2URL: https://datasheet.ciiva.com/7850/1018594-7850022.pdf?src-supplier=Element14; ComponentLink2Description: https://datasheet.ciiva.com/7850/1018594-7850022.pdf?src-supplier=Element14; ComponentLink3URL: https://datasheet.ciiva.com/7850/1018594-7850023.pdf?src-supplier=Element14; ComponentLink3Description: https://datasheet.ciiva.com/7850/1018594-7850023.pdf?src-supplier=Element14; ComponentLink4URL: https://datasheet.ciiva.com/15215/getdatasheetpartid-328119-15215035.pdf?src-supplier=Verical; ComponentLink4Description: https://datasheet.ciiva.com/15215/getdatasheetpartid-328119-15215035.pdf?src-supplier=Verical; Supplier Part Number 1: RC0402FR-074K7L; LCSC Part Number: C105871
SW1 SW2 = TS-1109S-C-B: No NO 50mA 4.5mm 100000 260gf 12V -30℃~+85℃ 4.5mm 4.3mm Black Round Button Brick nogging SPST SMD Tactile Switches ROHS; Manufacturer: XKB Connectivity; Item Type: Switch; Manufacturer Part Number: TS-1109S-C-B; Package: Custom; LCSC Part Number: C381037; ComponentLink1Description: LCSC; ComponentLink1URL: https://www.lcsc.com/product-detail/Tactile-Switches_XKB-Connectivity-TS-1109S-C-B_C381037.html
TP1 TP2 = TEST POINT 0.5mm Dia: Test Point ON; Item Type: Test Point; Manufacturer Part Number: TEST POINT 0.5mm Dia
U3 = ESP32-S3-WROOM-1-N8R2: SMD,18x25.5mm WiFi Modules ROHS; Manufacturer: Espressif Systems; Item Type: Module; Supplier 1: Digi-Key; Manufacturer Part Number: ESP32-S3-WROOM-1-N8R2; RoHS: No; Category: Uncategorized; Supplier Part Number 1: 1965-ESP32-S3-WROOM-1-N8R2-ND; ComponentLink1Description: LCSC; ComponentLink1URL: https://www.lcsc.com/product-detail/WiFi-Modules_Espressif-Systems-ESP32-S3-WROOM-1-N8R2_C2913204.html; LCSC Part Number: C2913204